# Altium schematic sheet CAN.SchDoc: Skipper CAN Transceiver
size 297 x 210 mm; Author: Jack Herron; SheetNumber: 8; SheetTotal: 11
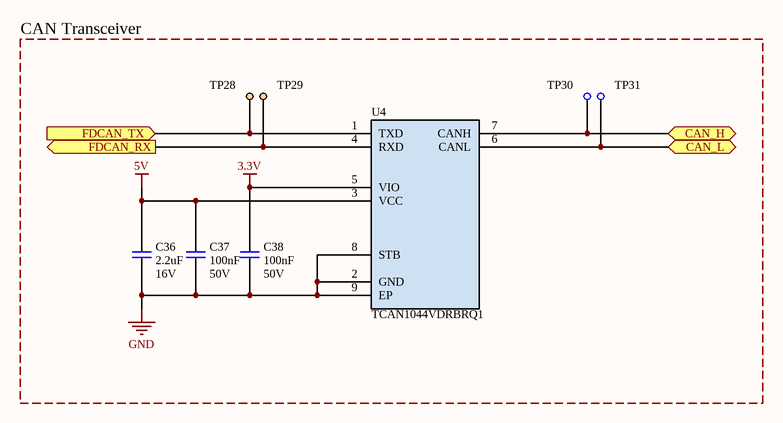
[diagram p0: CAN.SchDoc]

## Parts
C36  value 2.2uF  Voltage: 16V  [CAPACITOR-0603]  (hidden comment: CL10A225KO8NNNC)
C37  value 100nF  Voltage: 50V  [CAPACITOR-0402]  (hidden comment: CL05B104KB54PNC)
C38  value 100nF  Voltage: 50V  [CAPACITOR-0402]  (hidden comment: CL05B104KB54PNC)
TP28  Test Point 2mm  [TESTPOINT_2mm]  (value not drawn)  (no BOM)
TP29  Test Point 2mm  [TESTPOINT_2mm]  (value not drawn)  (no BOM)
TP30  RH-5019  [TESTPOINT_RH-5019]  (value not drawn)
TP31  RH-5019  [TESTPOINT_RH-5019]  (value not drawn)
U4  TCAN1044VDRBRQ1  [SON-8-3x3]

## Blocks framed on the sheet
CAN Transceiver: C36-C38 TP28-TP31 U4

## Ports
CAN_H (bidir, see Top_Sheet[2D], Bus_Access[3C]), CAN_L (bidir, see Top_Sheet[2D], Bus_Access[3C]), FDCAN_RX (out, see Top_Sheet[2C], MCU_IO[1C]), FDCAN_TX (in, see Top_Sheet[2C], MCU_IO[1C])

## Nets
3.3V: C38.2 U4.5(VIO)
5V: C36.2 C37.2 U4.3(VCC)
GND: C36.1 C37.1 C38.1 U4.2(GND) U4.8(STB) U4.9(EP)
CAN_H: TP30.1 U4.7(CANH) ; port CAN_H
CAN_L: TP31.1 U4.6(CANL) ; port CAN_L
FDCAN_RX: TP29.1 U4.4(RXD) ; port FDCAN_RX
FDCAN_TX: TP28.1 U4.1(TXD) ; port FDCAN_TX

## Notes on the sheet
- Title:
- File:
- Date:
- Project:
- Author:

## Library data of the parts
C36 = CAPACITOR_CL10A225KO8NNNC: Capacitor - 2.2uF - 16V - 0603 - X5R; Manufacturer 1: Samsung; Manufacturer Part Number 1: CL10A225KO8NNNC; Supplier 1: LCSC; Supplier Part Number 1: C23630
C37 C38 = CAPACITOR_CL05B104KB54PNC: Capacitor - 100nF - 50V - 0402 - X7R; Manufacturer 1: Samsung; Manufacturer Part Number 1: CL05B104KB54PNC; Supplier 1: LCSC; Supplier Part Number 1: C307331
TP28 TP29 = TESTPOINT_2mm: TestPoint 2mm
TP30 TP31 = TESTPOINT_RH-5019: SMD testpoint; Manufacturer 1: ronghe; Manufacturer Part Number 1: RH-5019; Supplier 1: LCSC; Supplier Part Number 1: C5199800
U4 = TRANSCEIVER_TCAN1044V: CAN Tranceiver; Manufacturer 1: Texas Instruments; Manufacturer Part Number 1: TCAN1044VDRBRQ1; Supplier 1: LCSC; Supplier Part Number 1: C5215851